# Altium schematic sheet task1.SchDoc
size A2
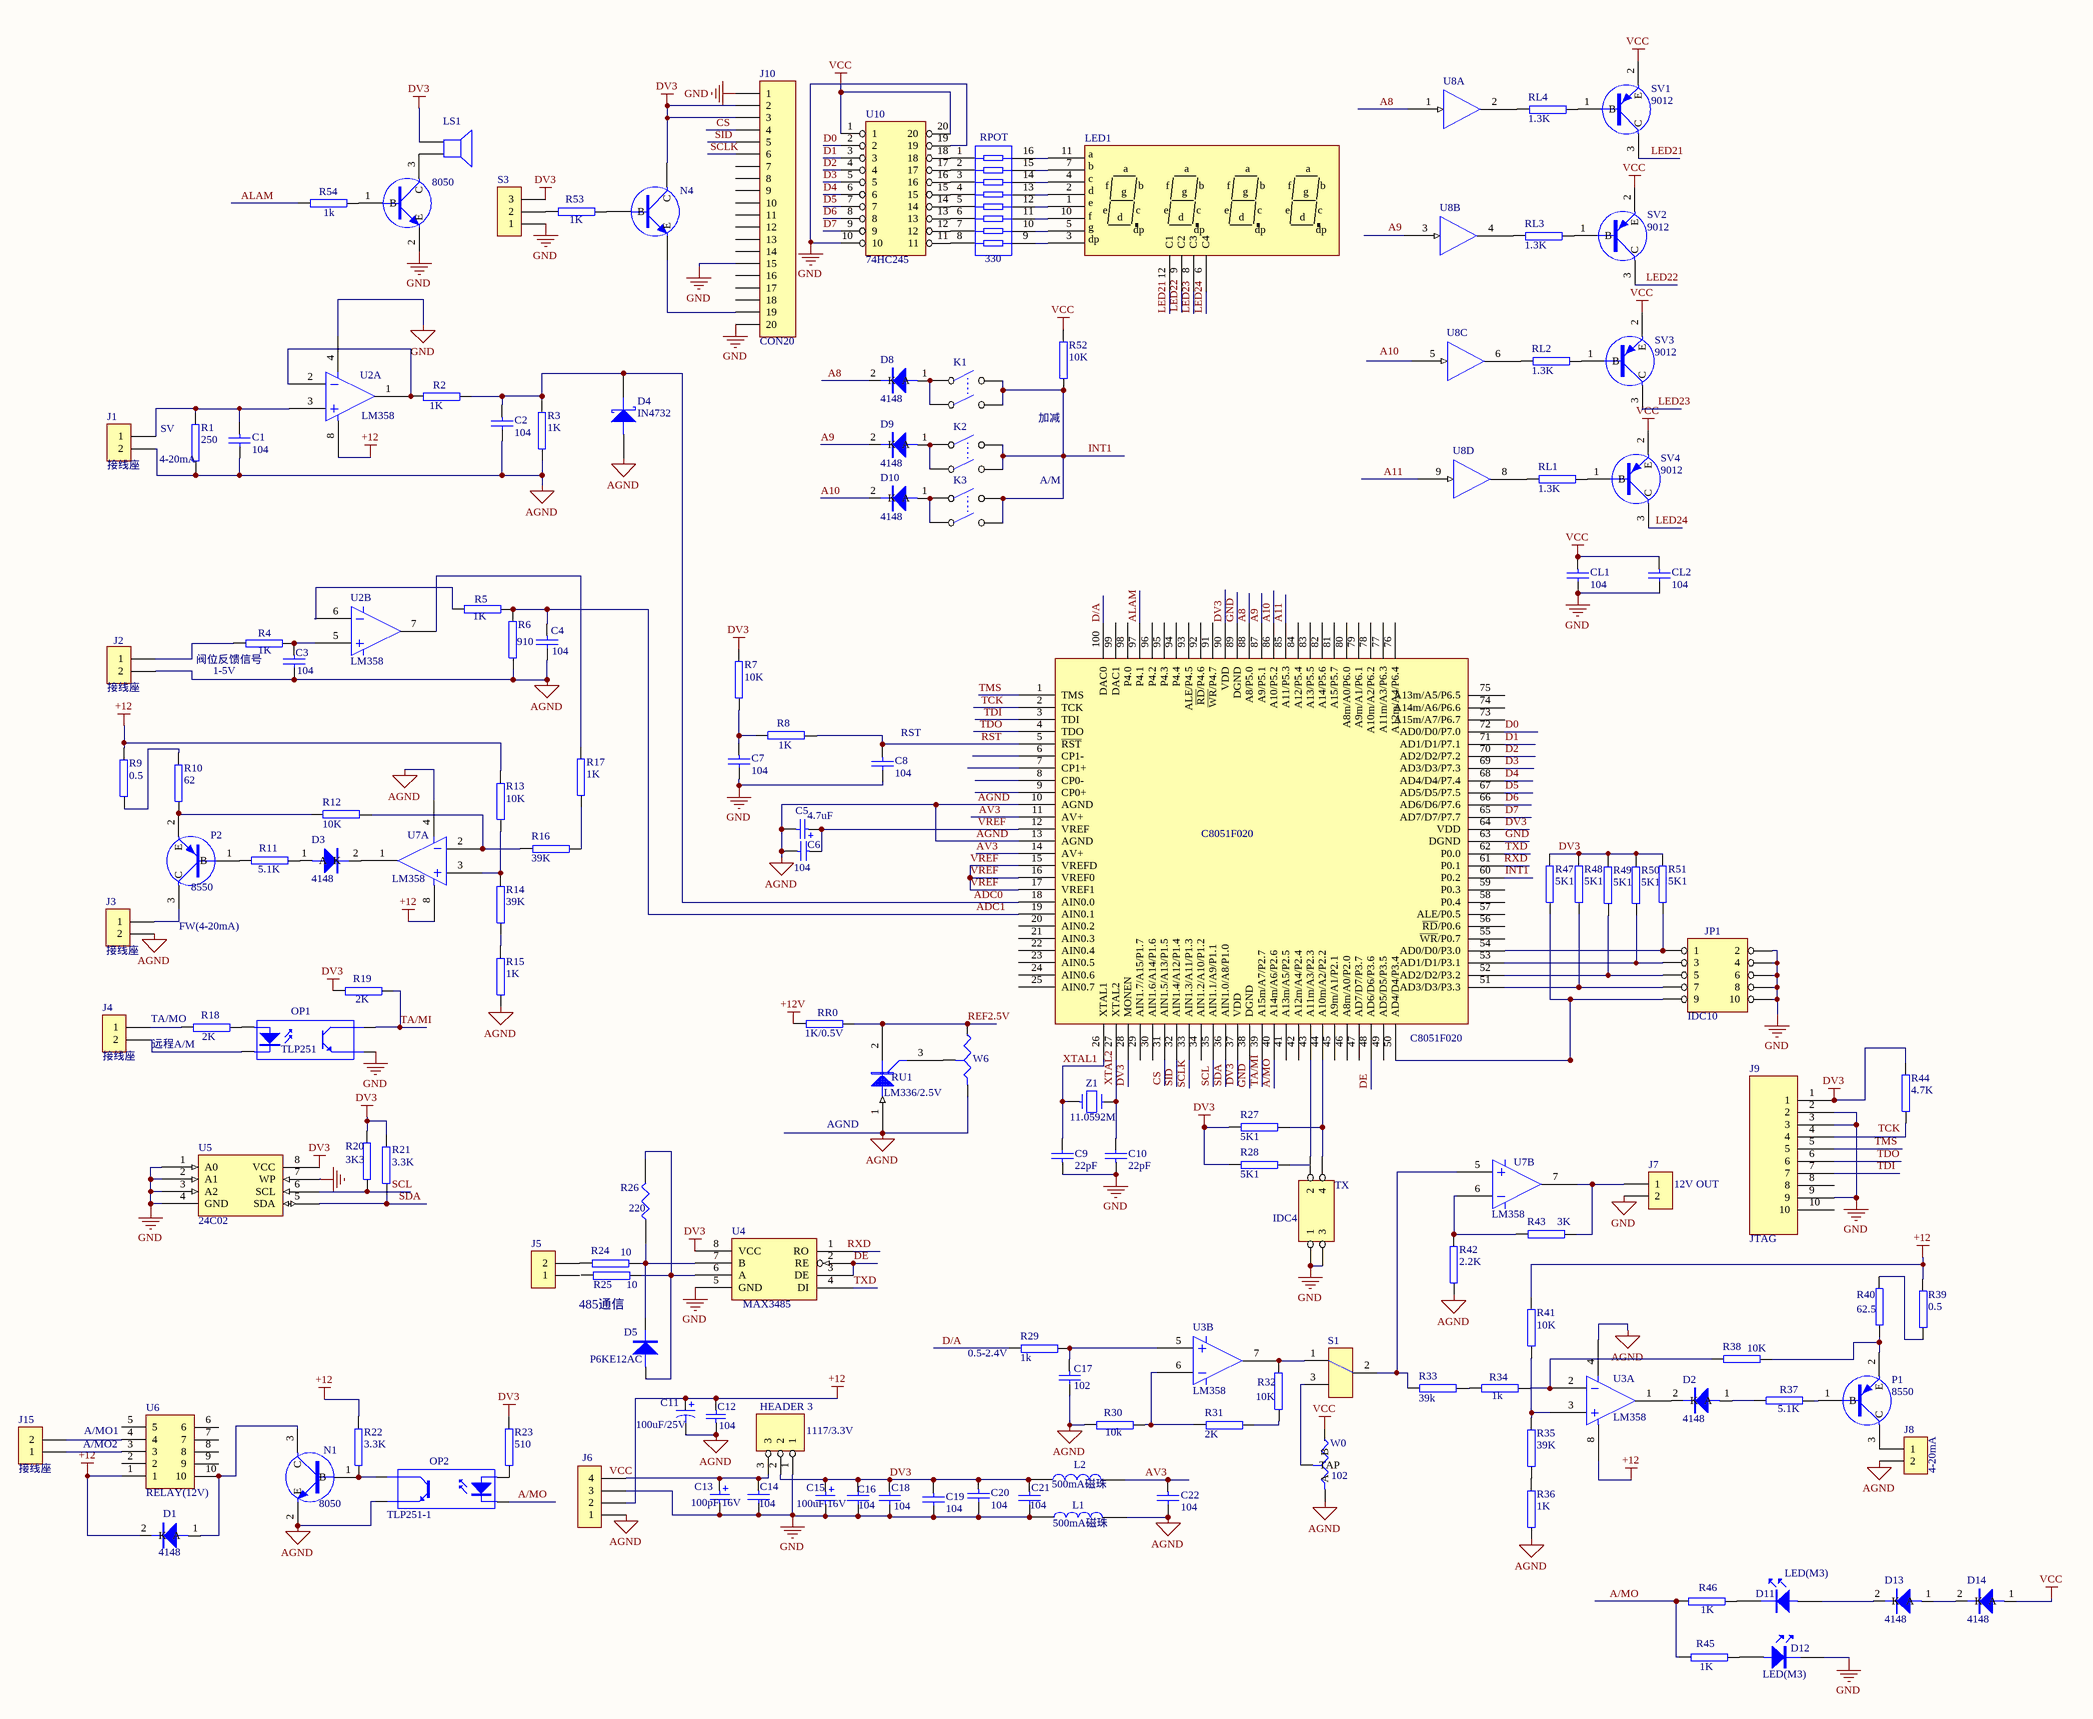
[diagram p0: task1.SchDoc]

## Parts
1117/3.3V  HEADER 3  [SOT-223/P2.3]
8050  NPN  [SOT-23]  (value not drawn)
?  C8051F020  [C8051F020]
C1  104  [0805]
C2  104  [0805]
C3  104  [0805]
C4  104  [0805]
C5  value 4.7uF  [POLAR0.8]  (hidden comment: Cap Pol2)
C6  value 104  [0805]  (hidden comment: Cap)
C7  104  [0805]
C8  104  [0805]
C9  22pF  [0805]
C10  22pF  [0805]
C11  value 100uF/25V  [POLAR0.8]  (hidden comment: Cap Pol1)
C12  value 104  [0805]  (hidden comment: Cap)
C13  value 100pF 16V  [POLAR0.8]  (hidden comment: Cap Pol2)
C14  104  [0805]
C15  value 100uF 16V  [POLAR0.8]  (hidden comment: Cap Pol2)
C16  104  [0805]
C17  102  [0805]
C18  104  [0805]
C19  104  [0805]
C20  104  [0805]
C21  104  [0805]
C22  104  [0805]
CL1  104  [0805]
CL2  104  [0805]
D1  4148  [D-DO214AC]
D2  4148  [D-DO214AC]
D3  4148  [D-DO214AC]
D4  IN4732  [DO-41]
D5  P6KE12AC  [D-DO214AC]
D8  4148  [D-DO214AC]
D9  4148  [D-DO214AC]
D10  4148  [D-DO214AC]
D11  LED(M3)  [LED]
D12  LED(M3)  [LED]
D13  4148  [D-DO214AC]
D14  4148  [D-DO214AC]
J1  接线座  [MIP-2]
J2  接线座  [MIP-2]
J3  接线座  [MIP-2]
J4  接线座  [MIP-2]
J5  CON2  [MIP-2]  (value not drawn)
J6  CON4  [MIP-4]  (value not drawn)
J7  12V OUT  [MIP-2]
J8  CON2  [MIP-2]  (value not drawn)
J9  JTAG  [MHDR1X10]
J10  CON20  [SIP20]
J15  接线座  [MIP-2]
JP1  IDC10  [IDC-10]
K1  SW-DPST  [KEY]  (value not drawn)
K2  SW-DPST  [KEY]  (value not drawn)
K3  SW-DPST  [KEY]  (value not drawn)
L1  500mA磁珠  [1808]
L2  500mA磁珠  [1808]
LED1  REDCC  [SX1]  (value not drawn)
LS1  SPEAKER  [FMQ]  (value not drawn)
N1  8050  [SOT-23]
N4  8050  [SOT-23]  (value not drawn)
OP1  TLP251  [DIP-4]
OP2  TLP251-1  [DIP-4]
P1  8550  [SOT-23]
P2  8550  [SOT-23]
R1  250  [0805]
R2  1K  [0805]
R3  1K  [0805]
R4  1K  [0805]
R5  1K  [0805]
R6  910  [0805]
R7  10K  [0805]
R8  1K  [0805]
R9  0.5  [0805]
R10  62  [0805]
R11  5.1K  [0805]
R12  10K  [0805]
R13  10K  [0805]
R14  39K  [0805]
R15  1K  [0805]
R16  39K  [0805]
R17  1K  [0805]
R18  2K  [0805]
R19  2K  [0805]
R20  3K3  [0805]
R21  3.3K  [0805]
R22  3.3K  [0805]
R23  510  [0805]
R24  10  [0805]
R25  10  [0805]
R26  220  [0805]
R27  5K1  [0805]
R28  5K1  [0805]
R29  1k  [0805]
R30  10k  [0805]
R31  2K  [0805]
R32  10K  [0805]
R33  39k  [0805]
R34  1k  [0805]
R35  39K  [0805]
R36  1K  [0805]
R37  5.1K  [0805]
R38  10K  [0805]
R39  0.5  [0805]
R40  62.5  [0805]
R41  10K  [0805]
R42  2.2K  [0805]
R43  3K  [0805]
R44  4.7K  [0805]
R45  1K  [0805]
R46  1K  [0805]
R47  5K1  [0805]
R48  5K1  [0805]
R49  5K1  [0805]
R50  5K1  [0805]
R51  5K1  [0805]
R52  10K  [0805]
R53  1K  [0805]
R54  1k  [0805]
RL1  1.3K  [0805]
RL2  1.3K  [0805]
RL3  1.3K  [0805]
RL4  1.3K  [0805]
RPOT  value 330  [SSOP16_N]  (hidden comment: Res Pack4)
RR0  1K/0.5V  [0805]
RU1  LM336/2.5V  [TO-92A]
S1  SW3  [HDR1x3H]  (value not drawn)
S3  CON3  [HDR1x3H]  (value not drawn)
SV1  9012  [SOT-23]
SV2  9012  [SOT-23]
SV3  9012  [SOT-23]
SV4  9012  [SOT-23]
TX  IDC4  [HDR2x2H]
U2  LM358  [SO8]  (parts A,B of 2)
U3  LM358  [SO8]  (parts A,B of 2)
U4  MAX3485  [SO8]
U5  24C02  [SO8]
U6  RELAY(12V)  [DIP10]
U7  LM358  [SO8]  (parts A,B of 2)
U8  7407  [SO14]  (value not drawn)  (parts A,B,C,D of 6)
U10  74HC245  [SOJ-20]
W0  102  [VR5]
W6  RESISTOR TAPPED  [VR5]  (value not drawn)
Z1  11.0592M  [RAD0.2]

## Nets
+12: C11.1 C12.2 D1.2(K) J6.2 R9.2 R13.2 R22.2 R39.1 R41.2 U2.8 U3.8 U6.1 U7.8
+12V: RR0.1
AGND: ?.10(AGND) ?.13(AGND) C1.2 C2.2 C3.2 C4.2 C5.2 C6.1 C11.2 C12.1 C17.2 C22.2 D4.1(A) J1.2 J2.2 J3.2 J6.1 J8.2 L1.2 N1.2(E) OP2.3(E) R1.1 R3.1 R6.1 R15.1 R30.1 R36.1 R42.1 RU1.1(A) U3.4 U7.4 W0.1(A) W6.1(A)
DV3: 1117/3.3V.2 ?.28(MONEN) ?.37(VDD) ?.64(VDD) ?.90(VDD) C15.1 C16.1 C18.1 C19.1 C20.1 C21.1 J9.1 J10.2 J10.3 L2.1 LS1.1 N4.3(C) R7.2 R19.1 R20.2 R21.2 R23.2 R27.1 R28.1 R44.2 R47.2 R48.2 R49.2 R50.2 R51.2 S3.3 U4.8(VCC) U5.8(VCC)
GND: 1117/3.3V.1 8050.2(E) ?.38(DGND) ?.63(DGND) ?.89(DGND) C7.2 C8.2 C9.1 C10.1 C13.2 C14.2 C15.2 C16.2 C18.2 C19.2 C20.2 C21.2 CL1.2 CL2.2 D12.2 J6.3 J7.2 J9.2 J9.3 J9.9 J10.1 J10.15 J10.20 JP1.2 JP1.4 JP1.6 JP1.8 JP1.10 L1.1 OP1.3(E) S3.1 TX.1 TX.3 U2.4 U4.5(GND) U5.1(A0) U5.2(A1) U5.3(A2) U5.4(GND) U5.7(WP) U8.7(GND) U10.10 U10.19
VCC: CL1.1 CL2.1 D14.1(A) R52.2 SV1.2(E) SV2.2(E) SV3.2(E) SV4.2(E) U8.14(VCC) U10.1 U10.20 W0.3(B)
A8: ?.88(A8/P5.0) D8.2(K) U8.1
A9: ?.87(A9/P5.1) D9.2(K)
A10: ?.86(A10/P5.2) D10.2(K)
A11: ?.85(A11/P5.3) U8.9
A/MO: ?.40(A14m/A6/P2.6) OP2.2(K) R45.1 R46.1
ADC0: ?.18(AIN0.0) C2.1 D4.2(K) R2.2 R3.2
ADC1: ?.19(AIN0.1) C4.1 R5.2 R6.2
ALAM: ?.97(P4.1) R54.1
AV3: ?.11(AV+) ?.14(AV+) C22.1 L2.2
CS: ?.31(AIN1.5/A13/P1.5) J10.4
D0: ?.72(AD0/D0/P7.0) U10.2
D1: ?.71(AD1/D1/P7.1) U10.3
D2: ?.70(AD2/D2/P7.2) U10.4
D3: ?.69(AD3/D3/P7.3) U10.5
D4: ?.68(AD4/D4/P7.4) U10.6
D5: ?.67(AD5/D5/P7.5) U10.7
D6: ?.66(AD6/D6/P7.6) U10.8
D7: ?.65(AD7/D7/P7.7) U10.9
D/A: ?.100(DAC0) R29.1
DE: ?.48(AD6/D6/P3.6) U4.2(RE) U4.3(DE)
INT1: ?.60(P0.2) K1.2 K1.4 K2.2 K2.4 K3.2 K3.4 R52.1
LED21: LED1.12(C1) SV1.3(C)
LED22: LED1.9(C2) SV2.3(C)
LED23: LED1.8(C3) SV3.3(C)
LED24: LED1.6(C4) SV4.3(C)
REF2.5V: RR0.2 RU1.2(K) W6.3(B)
RST: ?.5(~{RST}) C8.1 R8.1
SCL: ?.35(AIN1.1/A9/P1.1) R20.1 U5.6(SCL)
SCLK: ?.33(AIN1.3/A11/P1.3) J10.6
SDA: ?.36(AIN1.0/A8/P1.0) R21.1 U5.5(SDA)
SID: ?.32(AIN1.4/A12/P1.4) J10.5
TA/MI: ?.39(A15m/A7/P2.7) OP1.4(C) R19.2
TCK: ?.2(TCK)
TDI: ?.3(TDI) J9.7
TDO: ?.4(TDO) J9.6
TMS: ?.1(TMS) J9.5
TXD: ?.62(P0.0) U4.4(DI)
VREF: ?.12(VREF) ?.15(VREFD) ?.16(VREF0) ?.17(VREF1) C5.1 C6.2
XTAL1: ?.26(XTAL1) C9.2 Z1.1
XTAL2: ?.27(XTAL2) C10.2 Z1.2
Net1117/3.3V_3: 1117/3.3V.3 C13.1 C14.1 J6.4
Net8050_1: 8050.1(B) R54.2
Net8050_3: 8050.3(C) LS1.2
Net?_43: ?.43(A11m/A3/P2.3) TX.2
Net?_44: ?.44(A10m/A2/P2.2) R27.2 TX.4
Net?_50: ?.50(AD4/D4/P3.4) JP1.9 R47.1
Net?_51: ?.51(AD3/D3/P3.3) JP1.7 R48.1
Net?_52: ?.52(AD2/D2/P3.2) JP1.5 R49.1
Net?_53: ?.53(AD1/D1/P3.1) JP1.3 R50.1
Net?_54: ?.54(AD0/D0/P3.0) JP1.1 R51.1
NetC1_1: C1.1 J1.1 R1.2 U2.3
NetC3_1: C3.1 R4.2 U2.5
NetC7_1: C7.1 R7.1 R8.2
NetC17_1: C17.1 R29.2 U3.5
NetD1_1: D1.1(A) N1.3(C) U6.10
NetD2_1: D2.1(A) R37.2
NetD2_2: D2.2(K) U3.1
NetD3_1: D3.1(A) R11.1
NetD3_2: D3.2(K) U7.1
NetD5_1: D5.1(A) R25.2 R26.2 U4.6(A)
NetD5_2: D5.2(K) R24.2 R26.1 U4.7(B)
NetD8_1: D8.1(A) K1.1 K1.3
NetD9_1: D9.1(A) K2.1 K2.3
NetD10_1: D10.1(A) K3.1 K3.3
NetD11_1: D11.1 D13.2(K)
NetD11_2: D11.2 R46.2
NetD12_1: D12.1 R45.2
NetD13_1: D13.1(A) D14.2(K)
NetJ2_1: J2.1 R4.1
NetJ3_1: J3.1 P2.3(C)
NetJ4_1: J4.1 R18.1
NetJ4_2: J4.2 OP1.2(K)
NetJ5_2: J5.2 R24.1
NetJ7_1: J7.1 R43.2 U7.7
NetJ8_1: J8.1 P1.3(C)
NetJ9_4: J9.4 R44.1
NetJ10_19: J10.19 N4.2(E)
NetJ15_1: J15.1 U6.3
NetJ15_2: J15.2 U6.4
NetLED1_1: LED1.1(e) RPOT.12
NetLED1_2: LED1.2(d) RPOT.13
NetLED1_3: LED1.3(dp) RPOT.9
NetLED1_4: LED1.4(c) RPOT.14
NetLED1_5: LED1.5(g) RPOT.10
NetLED1_7: LED1.7(b) RPOT.15
NetLED1_10: LED1.10(f) RPOT.11
NetLED1_11: LED1.11(a) RPOT.16
NetN1_1: N1.1(B) OP2.4(C) R22.1
NetN4_1: N4.1(B) R53.2
NetOP1_1: OP1.1(A) R18.2
NetOP2_1: OP2.1(A) R23.1
NetP1_1: P1.1(B) R37.1
NetP1_2: P1.2(E) R38.1 R40.2
NetP2_1: P2.1(B) R11.2
NetP2_2: P2.2(E) R10.1 R12.2
NetR2_1: R2.1 U2.1 U2.2
NetR5_1: R5.1 U2.6
NetR9_1: R9.1 R10.2
NetR12_1: R12.1 R16.1 U7.2
NetR13_1: R13.1 R14.2 U7.3
NetR14_1: R14.1 R15.2
NetR16_2: R16.2 R17.1
NetR17_2: R17.2 U2.7
NetR30_2: R30.2 R31.1 U3.6
NetR31_2: R31.2 R32.1
NetR32_2: R32.2 S1.1 U3.7
NetR33_1: R33.1 R34.2
NetR33_2: R33.2 S1.2 U7.5
NetR34_1: R34.1 R38.2 U3.2
NetR35_1: R35.1 R36.2
NetR35_2: R35.2 R41.1 U3.3
NetR39_2: R39.2 R40.1
NetR42_2: R42.2 R43.1 U7.6
NetR53_1: R53.1 S3.2
NetRL1_1: RL1.1 U8.8
NetRL1_2: RL1.2 SV4.1(B)
NetRL2_1: RL2.1 U8.6
NetRL2_2: RL2.2 SV3.1(B)
NetRL3_1: RL3.1 U8.4
NetRL3_2: RL3.2 SV2.1(B)
NetRL4_1: RL4.1 U8.2
NetRL4_2: RL4.2 SV1.1(B)
NetRPOT_1: RPOT.1 U10.18
NetRPOT_2: RPOT.2 U10.17
NetRPOT_3: RPOT.3 U10.16
NetRPOT_4: RPOT.4 U10.15
NetRPOT_5: RPOT.5 U10.14
NetRPOT_6: RPOT.6 U10.13
NetRPOT_7: RPOT.7 U10.12
NetRPOT_8: RPOT.8 U10.11
NetRU1_3: RU1.3(G) W6.2(TAP)
NetS1_3: S1.3 W0.2(TAP)

Not connected (* = marked no-connect by the designer): ? 6(CP1-) 7(CP1+) 8(CP0-) 9(CP0+) 20(AIN0.2) 21(AIN0.3) 22(AIN0.4) 23(AIN0.5) 24(AIN0.6) 25(AIN0.7) 29(AIN1.7/A15/P1.7) 30(AIN1.6/A14/P1.6) 34(AIN1.2/A10/P1.2) 41(A13m/A5/P2.5) 42(A12m/A4/P2.4) 45(A9m/A1/P2.1) 46(A8m/A0/P2.0) 47(AD7/D7/P3.7) 49(AD5/D5/P3.5) 55(~{WR}/P0.7) 56(~{RD}/P0.6) 57(ALE/P0.5) 58(P0.4) 59(P0.3) 61(P0.1) 73(A15m/A7/P6.7) 74(A14m/A6/P6.6) 75(A13m/A5/P6.5) 76(A12m/A4/P6.4) 77(A11m/A3/P6.3) 78(A10m/A2/P6.2) 79(A9m/A1/P6.1) 80(A8m/A0/P6.0) 81(A15/P5.7) 82(A14/P5.6) 83(A13/P5.5) 84(A12/P5.4) 91(~{WR}/P4.7) 92(~{RD}/P4.6) 93(ALE/P4.5) 94(P4.4) 95(P4.3) 96(P4.2) 98(P4.0) 99(DAC1); J5 1; J9 8 10; J10 7 8 9 10 11 12 13 14 16 17 18; R25 1; R28 2; U4 1(RO); U6 2 5 6 7 8 9; U8 3 5

## Notes on the sheet
- 加减
- (near R1) 4-20mA
- SV
- A/M
- (near J2) J2
- (near R4) 阀位反馈信号
- (near R4) 1-5V
- (near C8) RST
- FW(4-20mA)
- TA/MO
- 远程A/M
- (near RU1) AGND
- 485通信
- (near R29) 0.5-2.4V
- A/MO2
- A/MO1
- (near J8) 4-20mA
- Labels drawn without touching a wire or pin: A9, A10, RXD, TCK, VCC
- Title
- Size:
- Date:
- File:
- A2
- Number:
- Time:
- Revision:
- Sheet
- of

## Library data of the parts
8050 N1 N4 = NPN: NPN Transistor
? = C8051F020.2
C1-C4 C7-C10 C14 C16-C22 CL1 CL2 = CAP: Capacitor
C5 C13 C15 = Cap Pol2: Polarized Capacitor (Axial); Published: 8-Jun-2000; LatestRevisionDate: 17-Jul-2002; LatestRevisionNote: Re-released for DXP Platform.; PackageReference: POLAR0.8; Publisher: Altium Limited; PackageDescription: Polarized Capacitor; 2 Leads
C6 C12 = Cap: Capacitor; Published: 8-Jun-2000; LatestRevisionDate: 17-Jul-2002; LatestRevisionNote: Re-released for DXP Platform.; PackageReference: RAD-0.3; Publisher: Altium Limited; PackageDescription: Radial Cap, Thru-Hole; 2 Leads; 0.3 in Pin Spacing
C11 = Cap Pol1: Polarized Capacitor (Radial); Published: 8-Jun-2000; LatestRevisionDate: 17-Jul-2002; LatestRevisionNote: Re-released for DXP Platform.; PackageReference: RB7.6-15; Publisher: Altium Limited; PackageDescription: Polarized Capacitor (Radial); 2 Leads
D1-D3 D5 D8-D10 D13 D14 = DIODE
D4 = DIODE SCHOTTKY: Schottky Diode
D11 D12 = LED
J1-J5 J7 J8 J15 = CON2: Connector
J6 = CON4: Connector
J9 = 10PIN
J10 = CON20: Connector
JP1 = HEADER 5X2
L1 L2 = INDUCTOR1
LED1 = REDCC: Common Cathhode Seven-Segment Display, Right Hand Decimal
OP1 OP2 = OPTOISO1: Optoisolator
P1 P2 SV1-SV4 = PNP: PNP Transistor
R1-R25 R27-R54 RL1-RL4 RR0 = RES2
R26 = RES1
RPOT = Res Pack4: Isolated Resistor Network; Published: 24-Mar-1999; LatestRevisionDate: 29-May-2009; LatestRevisionNote: IPC-7351 Footprint Added.; PackageVersion: Oct-2003; PackageReference: SSOP16; Publisher: Altium Limited; PackageDescription: 16-Pin Plastic Small Outline Package 0.65 mm Pitch; Code_JEDEC: MO-150-AC; Code_IPC: SOP65P780-16
RU1 = ProE5.tmp_LM336_6
S3 = CON3: Connector
TX = HEADER 2X2
U2 = MC34002
U4 = MAX488
U5 = 24C04
U6 = RELAY
U10 = HEADER 10X2
W0 = RESISTOR TAPPED
Z1 = CRYSTAL